# Altium schematic sheet main.SchDoc
size A3; SheetNumber: 1; SheetTotal: 1
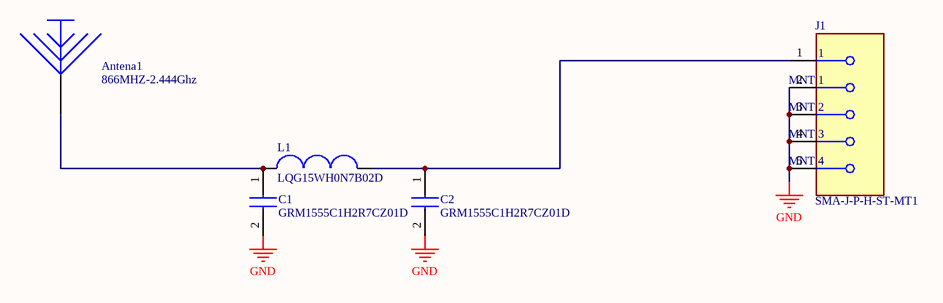
[diagram p0: main.SchDoc]

## Parts
Antena1  866MHZ-2.444Ghz  [antena]  (no BOM)
C1  GRM1555C1H2R7CZ01D  [CAPC1005X70N]
C2  GRM1555C1H2R7CZ01D  [CAPC1005X70N]
J1  SMA-J-P-H-ST-MT1  [FP-SMA-J-P-H-ST-MT1-MFG]
L1  LQG15WH0N7B02D  [LQG15WH0N7B02D]

## Nets
GND: C1.2 C2.2 J1.2(MNT_1) J1.3(MNT_2) J1.4(MNT_3) J1.5(MNT_4)
NetAntena1_1: Antena1.1(Antena) C1.1 L1.1
NetC2_1: C2.1 J1.1 L1.2

## Library data of the parts
Antena1 = Antena
C1 C2 = GRM1555C1H2R7CZ01D: Capacitor; Manufacturer_Name: Murata Electronics; Datasheet Link: http://www.murata.com/~/media/webrenewal/support/library/catalog/products/capacitor/mlcc/c02e.pdf; Height: 0.7mm; Manufacturer_Part_Number: GRM1555C1H2R7CZ01D; Mouser Part Number: 81-GRM36C2R7C50; Mouser Price/Stock: https://www.mouser.com/Search/Refine.aspx?Keyword=81-GRM36C2R7C50
J1 = CMP-02754-000007-1: CONN SMA JACK STR 50 OHM SMD; Dielectric Material: PTFE; Voltage Rating: 335V; Body Material: Brass; Center Contact Plating: Gold; Impedance: 50R; Number of Ports: 1; Max Frequency: 20GHz; Mount: Surface Mount; Contact Plating: Gold; Housing Color: Gold; Series: -; Fastening Type: Threaded; Packaging: Bulk; Connector Type: SMA; Contact Material: Copper Alloy; Body Plating: Gold; Case/Package: SMA; Termination: Solder; RoHS Compliant: No; Min Operating Temperature: -65°C; Max Operating Temperature: 125°C